# Altium schematic sheet Ethernet.SchDoc: Ethernet connector and status LEDs
size A4; DocumentNumber: ADC-SCH-12; SheetNumber: 12; SheetTotal: 20
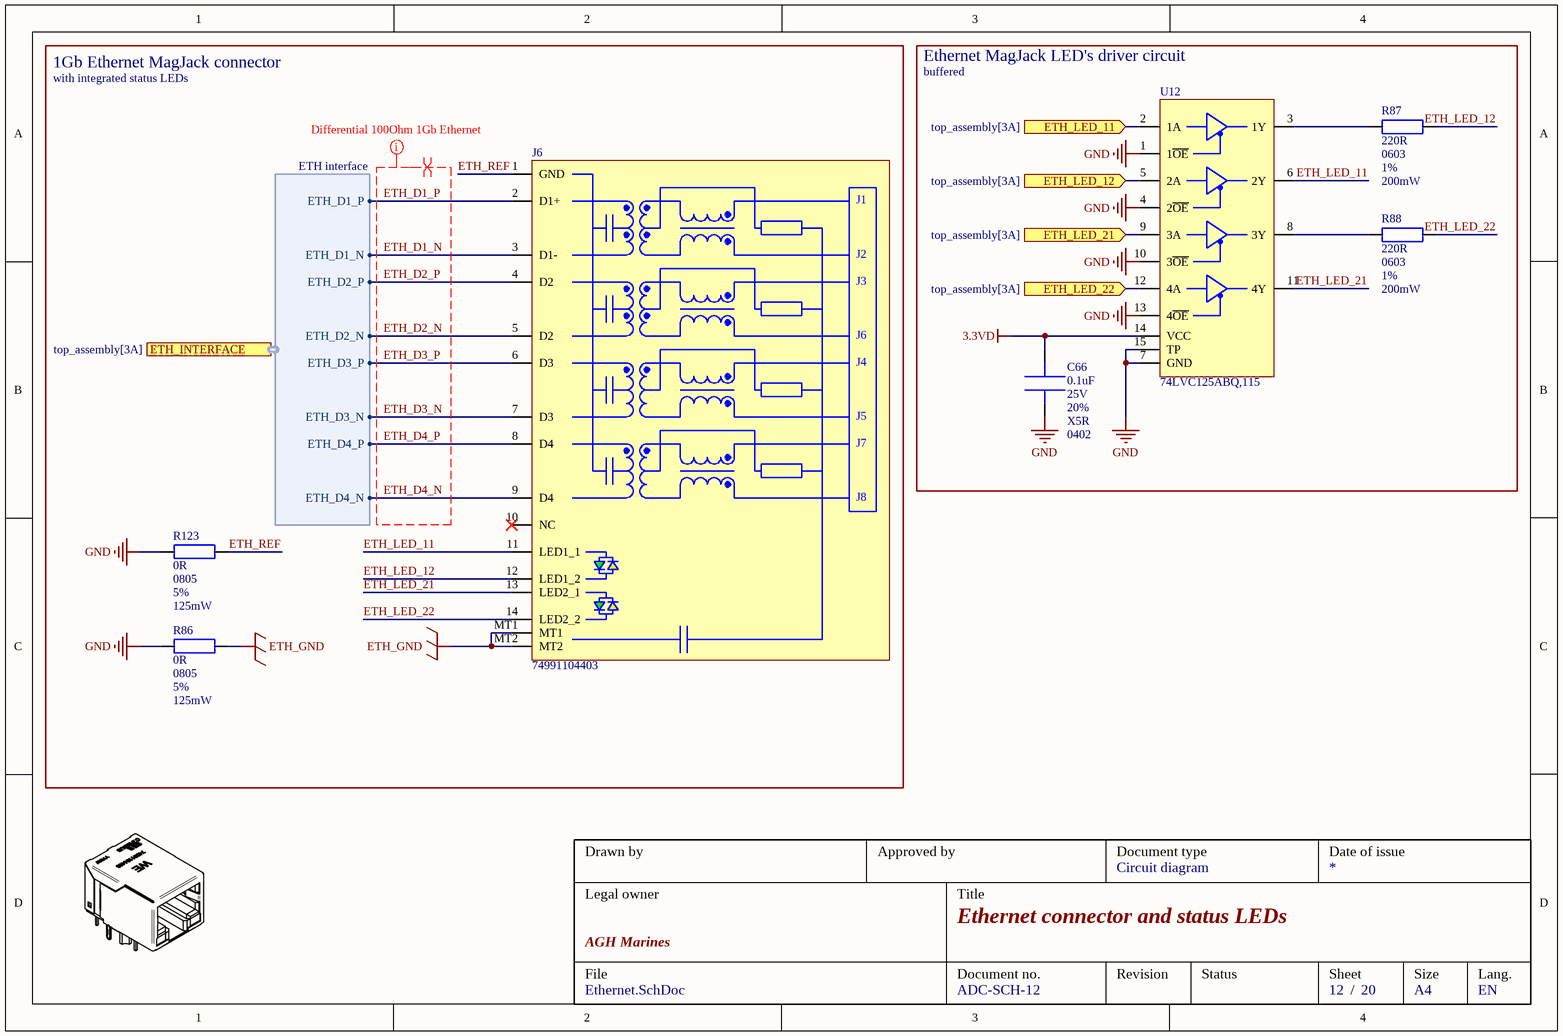
[diagram p0: Ethernet.SchDoc]

## Parts
C66  value 0.1uF  Voltage: 25V  Tolerance: 20%  Dielectric: X5R  Package: 0402  [CAPC_0402]  (hidden comment: MSAST105SB5104MFNA01)
J6  74991104403  [CONT_74991104403]
R86  value 0R  Package: 0805  Tolerance: 5%  Power: 125mW  [RESC_0805]  (hidden comment: RC0805JR-070RP)
R87  value 220R  Package: 0603  Tolerance: 1%  Power: 200mW  [RESC_0603]  (hidden comment: AC0603FR-7W220RL)
R88  value 220R  Package: 0603  Tolerance: 1%  Power: 200mW  [RESC_0603]  (hidden comment: AC0603FR-7W220RL)
R123  value 0R  Package: 0805  Tolerance: 5%  Power: 125mW  [RESC_0805]  (hidden comment: RC0805JR-070RP)
U12  74LVC125ABQ,115  [IC_DHVQFN-14]

## Blocks framed on the sheet
1Gb Ethernet MagJack connector: J6 R86 R123

## Ports
ETH_INTERFACE (harness ETH interface, see top_assembly[3A]), ETH_LED_11 (in, see top_assembly[3A]), ETH_LED_12 (in, see top_assembly[3A]), ETH_LED_21 (in, see top_assembly[3A]), ETH_LED_22 (in, see top_assembly[3A])

## Harnesses
ETH interface: ETH_D1_P, ETH_D1_N, ETH_D2_P, ETH_D2_N, ETH_D3_P, ETH_D3_N, ETH_D4_P, ETH_D4_N

## Nets
3.3VD: C66.1 U12.14(VCC)
ETH_GND: J6.MT1 J6.MT2 R86.1
GND: C66.2 R86.2 R123.2 U12.1(1~{OE}) U12.4(2~{OE}) U12.7(GND) U12.10(3~{OE}) U12.13(4~{OE}) U12.15(TP)
ETH_D1_N: J6.3(D1-) ; port ETH_INTERFACE.ETH_D1_N
ETH_D1_P: J6.2(D1+) ; port ETH_INTERFACE.ETH_D1_P
ETH_D2_N: J6.5(D2) ; port ETH_INTERFACE.ETH_D2_N
ETH_D2_P: J6.4(D2) ; port ETH_INTERFACE.ETH_D2_P
ETH_D3_N: J6.7(D3) ; port ETH_INTERFACE.ETH_D3_N
ETH_D3_P: J6.6(D3) ; port ETH_INTERFACE.ETH_D3_P
ETH_D4_N: J6.9(D4) ; port ETH_INTERFACE.ETH_D4_N
ETH_D4_P: J6.8(D4) ; port ETH_INTERFACE.ETH_D4_P
ETH_LED_11: J6.11(LED1_1) U12.6(2Y)
ETH_LED_11: U12.2(1A) ; port ETH_LED_11  [a separate net that carries the same name]
ETH_LED_12: J6.12(LED1_2) R87.1
ETH_LED_12: U12.5(2A) ; port ETH_LED_12  [a separate net that carries the same name]
ETH_LED_21: J6.13(LED2_1) U12.11(4Y)
ETH_LED_21: U12.9(3A) ; port ETH_LED_21  [a separate net that carries the same name]
ETH_LED_22: J6.14(LED2_2) R88.1
ETH_LED_22: U12.12(4A) ; port ETH_LED_22  [a separate net that carries the same name]
ETH_REF: J6.1(GND) R123.1
NetR87_2: R87.2 U12.3(1Y)
NetR88_2: R88.2 U12.8(3Y)

Not connected (* = marked no-connect by the designer): J6 10(NC)*

## Layout directives
differential pair; differential pair class 100OhmDiff: ETH_D1_N, ETH_D1_P, ETH_D2_N, ETH_D2_P, ETH_D3_N, ETH_D3_P, ETH_D4_N, ETH_D4_P
mark named Differential 100Ohm 1Gb Ethernet: ETH_D1_N, ETH_D1_P, ETH_D2_N, ETH_D2_P, ETH_D3_N, ETH_D3_P, ETH_D4_N, ETH_D4_P

## Notes on the sheet
- with integrated status LEDs
- Ethernet MagJack LED's driver circuit
- buffered
- Drawn by
- Approved by
- Document type
- Date of issue
- Legal owner
- Title
- Circuit diagram
- File
- AGH Marines
- Document no.
- Revision
- Status
- Sheet
- Size
- Lang.
- /
- A4
- EN
- (in symbol 74991104403) J1; J2; J3; J4; J5; J7; J8

## Library data of the parts
C66 = MSAST105SB5104MFNA01: Multilayer Ceramic Capacitors MLCC - SMD/SMT 25V 0.1uF X5R 0402 20%; Manufacturer: TAIYO YUDEN; Supplier 1: Mouser; Supplier Part Number 1: 963-MSAST105SB5104MF
J6 = 74991104403: Modular Connectors / Ethernet Connectors WE-RJ45LAN 10/100/1000BASE-T THT 1x1 LED L green/yellow LED R green/yellow; Manufacturer: Wurth Elektronik; Supplier 1: Mouser; Supplier Part Number 1: 710-74991104403
R86 R123 = RC0805JR-070RP: Thick Film Resistors - SMD General Purpose Chip Resistor 0805, 0Ohms, 5%, 1/8W; Manufacturer: YAGEO; Supplier 1: Mouser; Supplier Part Number 1: 603-RC0805JR-070RP
R87 R88 = AC0603FR-7W220RL: Thick Film Resistors - SMD 220 Ohms 1/5 W 75 V 1% 0603 100 PPM / C - 55 C / + 155 C AEC-Q200; Manufacturer: YAGEO; Supplier 1: Mouser; Supplier Part Number 1: 603-AC0603FR-7W220RL
U12 = 74LVC125ABQ,115: Buffers & Line Drivers SOT762-1 BUFFERS & LINE DVRS; Manufacturer: Nexperia; Package: DHVQFN-14; Supplier 1: Mouser; Supplier Part Number 1: 771-LVC125ABQ115